# Altium schematic sheet RS232-Sheet.SchDoc
size 420 x 297 mm; SheetNumber: 9; SheetTotal: 15
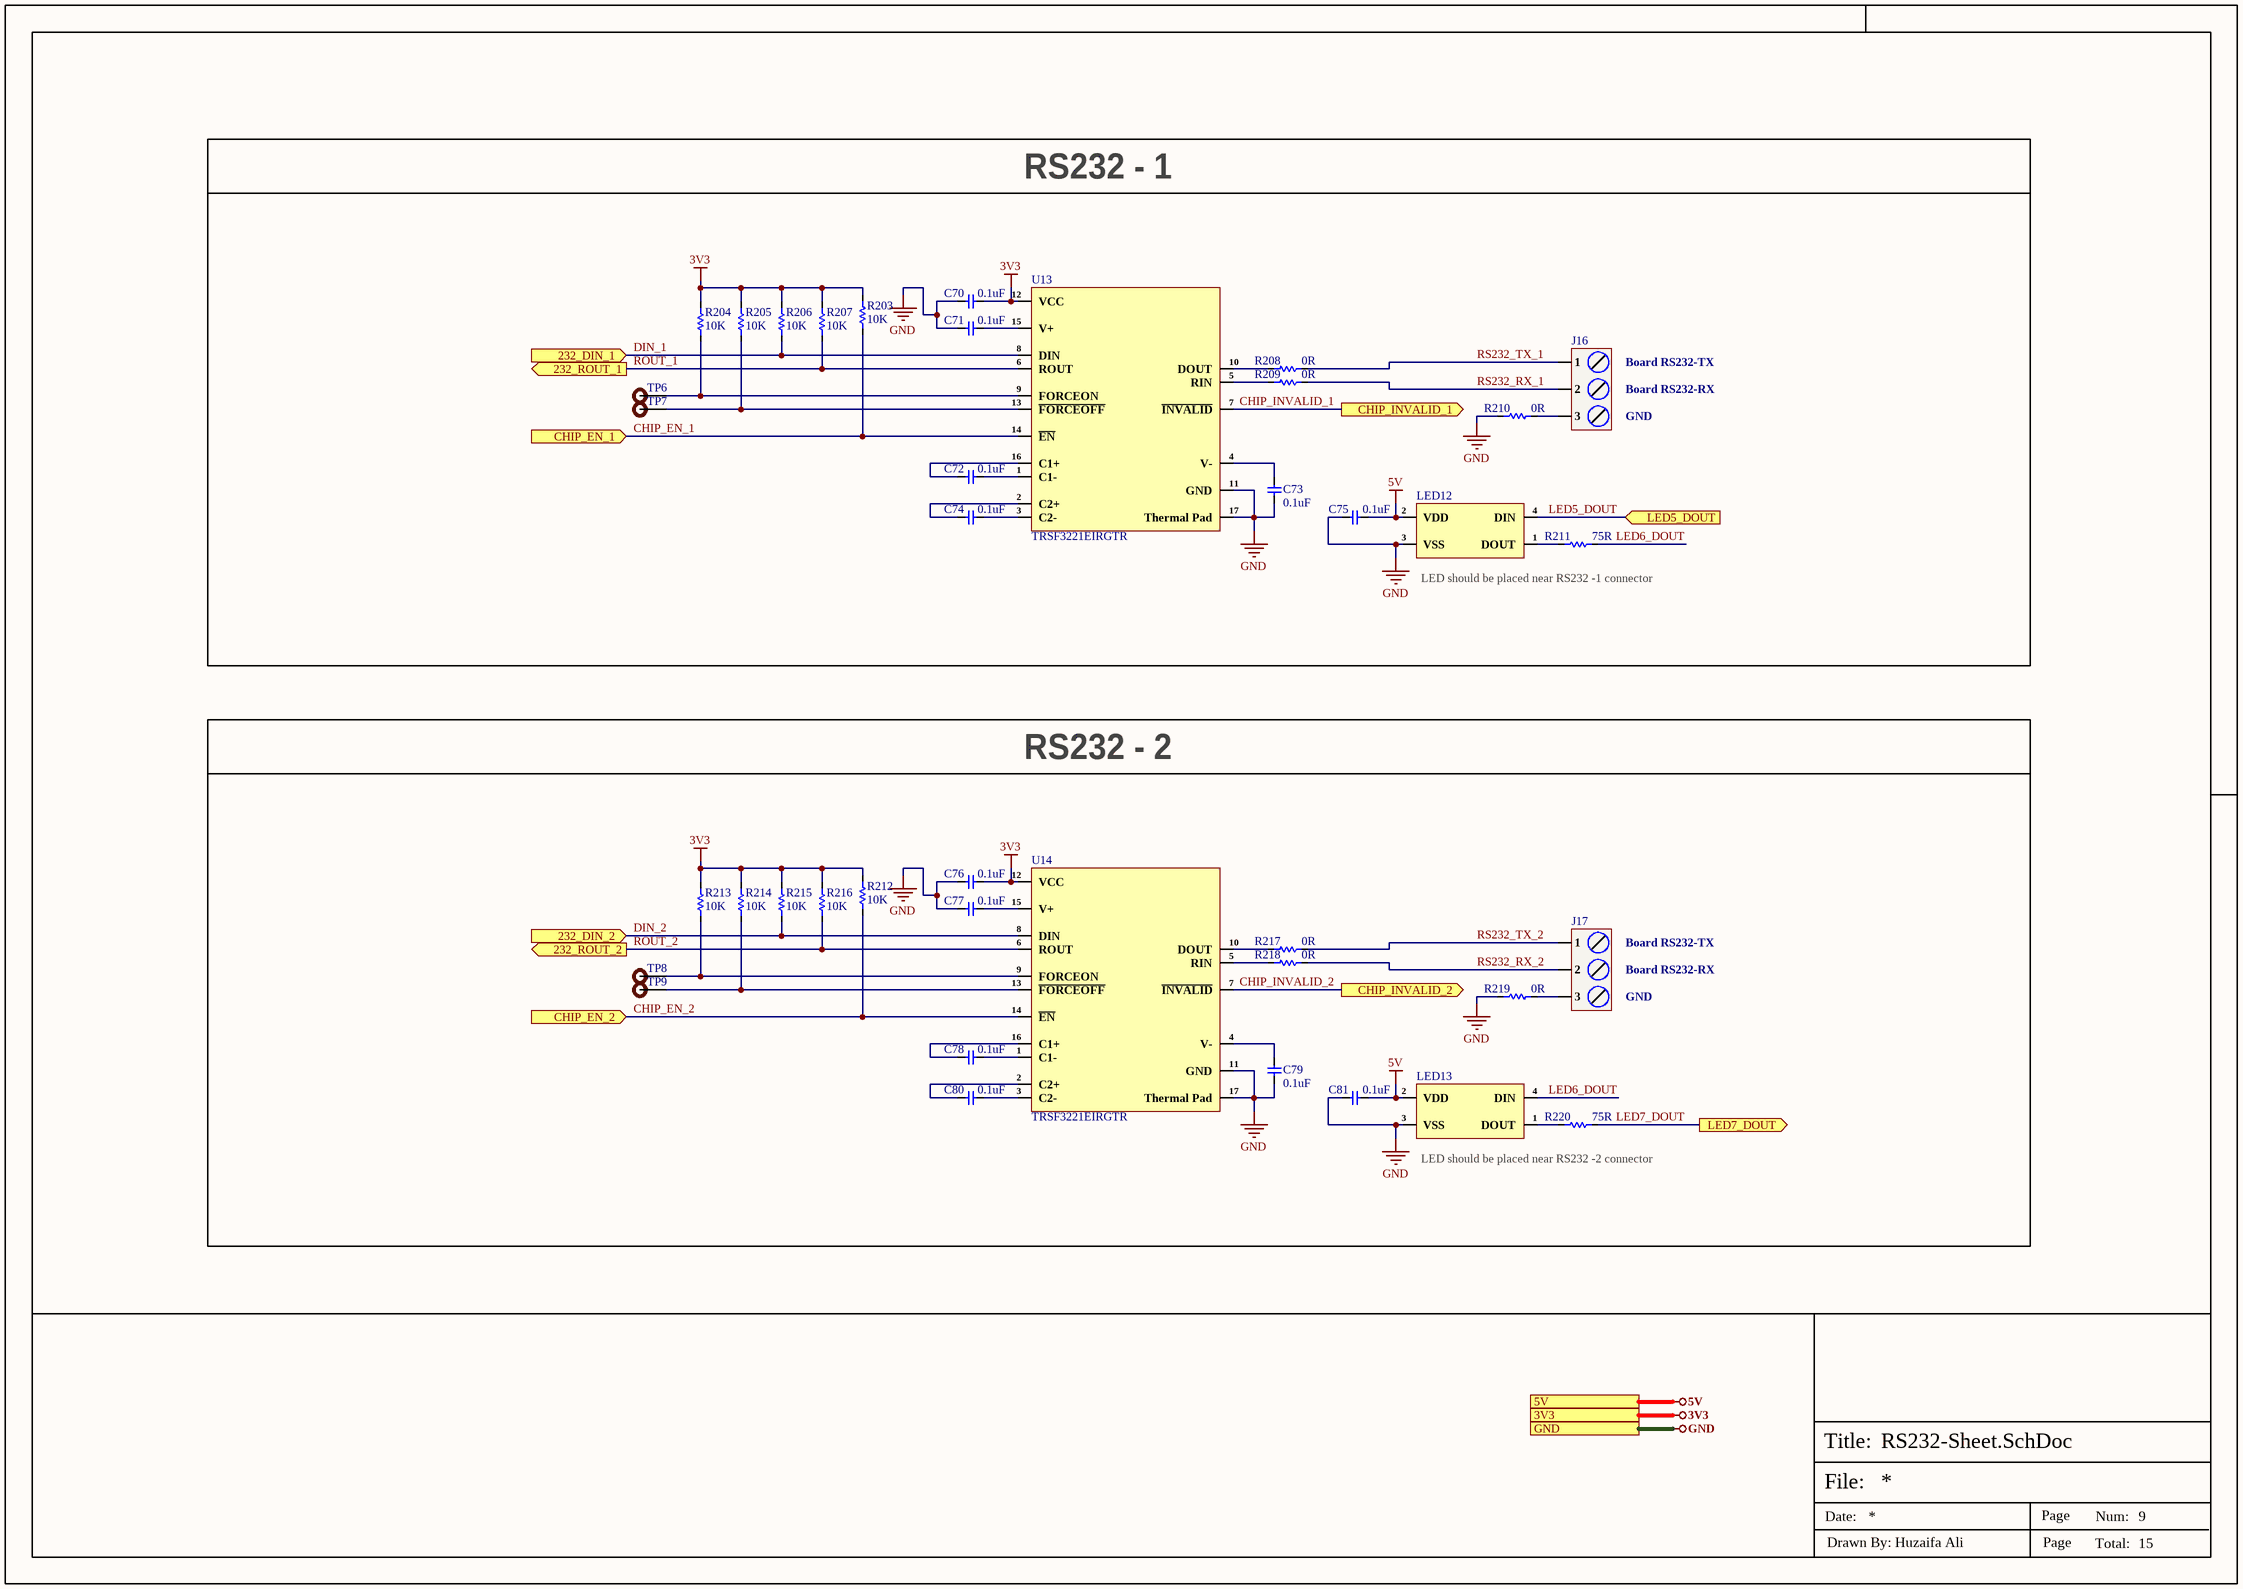
[diagram p0: RS232-Sheet.SchDoc]

## Parts
C70  0.1uF  [Cap-0402]
C71  0.1uF  [Cap-0402]
C72  0.1uF  [Cap-0402]
C73  0.1uF  [Cap-0402]
C74  0.1uF  [Cap-0402]
C75  0.1uF  [Cap-0402]
C76  0.1uF  [Cap-0402]
C77  0.1uF  [Cap-0402]
C78  0.1uF  [Cap-0402]
C79  0.1uF  [Cap-0402]
C80  0.1uF  [Cap-0402]
C81  0.1uF  [Cap-0402]
J16  DB128L-5.08-3P-GN-S  [DB128L-5.08-3P-GN-S]  (value not drawn)
J17  DB128L-5.08-3P-GN-S  [DB128L-5.08-3P-GN-S]  (value not drawn)
LED12  WS2812D-F5  [WS2812D-F5]  (value not drawn)
LED13  WS2812D-F5  [WS2812D-F5]  (value not drawn)
R203  10K  [Res-0402]
R204  10K  [Res-0402]
R205  10K  [Res-0402]
R206  10K  [Res-0402]
R207  10K  [Res-0402]
R208  0R  [Res-0402]
R209  0R  [Res-0402]
R210  0R  [Res-0402]
R211  75R  [Res-0402]
R212  10K  [Res-0402]
R213  10K  [Res-0402]
R214  10K  [Res-0402]
R215  10K  [Res-0402]
R216  10K  [Res-0402]
R217  0R  [Res-0402]
R218  0R  [Res-0402]
R219  0R  [Res-0402]
R220  75R  [Res-0402]
TP6  TEST POINT  [Test-point]  (value not drawn)  (no BOM)
TP7  TEST POINT  [Test-point]  (value not drawn)  (no BOM)
TP8  TEST POINT  [Test-point]  (value not drawn)  (no BOM)
TP9  TEST POINT  [Test-point]  (value not drawn)  (no BOM)
U13  TRSF3221EIRGTR  [16-QFN (3x3).]
U14  TRSF3221EIRGTR  [16-QFN (3x3).]

## Blocks framed on the sheet
RS232 - 1: C70-C75 J16 LED12 R203-R211 TP6 TP7 U13
RS232 - 2: C76-C81 J17 LED13 R212-R220 TP8 TP9 U14

## Ports
3V3 (see Top-Sheet[5B], Buttons-Lights-Sensors-Sheet[4D], CAN-Sheet[5D], Controller-Sheet-1[4D], Controller-Sheet-2[4D], EtherCAT-Sheet[1D], Ethernet-PHY-Sheet[4D], Power-Sheet[4D], RS485-Sheet[5D], USB-Sheet[4D], VFD-Support-Sheet[4D]), 5V (see Top-Sheet[5B], Buttons-Lights-Sensors-Sheet[4D], CAN-Sheet[5D], Controller-Sheet-2[4D], Power-Sheet[4D], RS485-Sheet[5D], USB-Sheet[4D], VFD-Support-Sheet[4D]), 232_DIN_1 (in, see Top-Sheet[5B]), 232_DIN_2 (in, see Top-Sheet[5B]), 232_ROUT_1 (out, see Top-Sheet[5B]), 232_ROUT_2 (out, see Top-Sheet[5B]), CHIP_EN_1 (in, see Top-Sheet[5B]), CHIP_EN_2 (in, see Top-Sheet[5B]), CHIP_INVALID_1 (out, see Top-Sheet[5B]), CHIP_INVALID_2 (out, see Top-Sheet[5B]), GND (see Top-Sheet[5B], Buttons-Lights-Sensors-Sheet[4D], CAN-Sheet[6D], Controller-Sheet-1[4D], Controller-Sheet-2[4D], Controller-Sheet-3[4D], EtherCAT-Sheet[1D], Ethernet-PHY-Sheet[4D], Extra-DIOs[4D], Power-Sheet[4D], RS485-Sheet[5D], USB-Sheet[4D], VFD-Support-Sheet2[4D], VFD-Support-Sheet[4D]), LED5_DOUT (in, see Top-Sheet[5B], CAN-Sheet[5D]), LED7_DOUT (out, see Top-Sheet[5B], RS485-Sheet[5A])

## Nets
3V3: C70.1 C76.1 R203.1 R204.1 R205.1 R206.1 R207.1 R212.1 R213.1 R214.1 R215.1 R216.1 U13.12(VCC) U14.12(VCC) ; port 3V3
5V: C75.2 C81.2 LED12.2(VDD) LED13.2(VDD) ; port 5V
GND: C70.2 C71.2 C73.2 C75.1 C76.2 C77.2 C79.2 C81.1 LED12.3(VSS) LED13.3(VSS) R210.1 R219.1 U13.11(GND) U13.17(Thermal_Pad) U14.11(GND) U14.17(Thermal_Pad) ; port GND
CHIP_EN_1: R203.2 U13.14(~{EN}) ; port CHIP_EN_1
CHIP_EN_2: R212.2 U14.14(~{EN}) ; port CHIP_EN_2
CHIP_INVALID_1: U13.7(~{INVALID}) ; port CHIP_INVALID_1
CHIP_INVALID_2: U14.7(~{INVALID}) ; port CHIP_INVALID_2
DIN_1: R206.2 U13.8(DIN) ; port 232_DIN_1
DIN_2: R215.2 U14.8(DIN) ; port 232_DIN_2
LED5_DOUT: LED12.4(DIN) ; port LED5_DOUT
LED6_DOUT: LED13.4(DIN) R211.2
LED7_DOUT: R220.2 ; port LED7_DOUT
ROUT_1: R207.2 U13.6(ROUT) ; port 232_ROUT_1
ROUT_2: R216.2 U14.6(ROUT) ; port 232_ROUT_2
RS232_RX_1: J16.2 R209.1
RS232_RX_2: J17.2 R218.1
RS232_TX_1: J16.1 R208.1
RS232_TX_2: J17.1 R217.1
NetC71_1: C71.1 U13.15(V+)
NetC72_1: C72.1 U13.1(C1-)
NetC72_2: C72.2 U13.16(C1+)
NetC73_1: C73.1 U13.4(V-)
NetC74_1: C74.1 U13.3(C2-)
NetC74_2: C74.2 U13.2(C2+)
NetC77_1: C77.1 U14.15(V+)
NetC78_1: C78.1 U14.1(C1-)
NetC78_2: C78.2 U14.16(C1+)
NetC79_1: C79.1 U14.4(V-)
NetC80_1: C80.1 U14.3(C2-)
NetC80_2: C80.2 U14.2(C2+)
NetJ16_3: J16.3 R210.2
NetJ17_3: J17.3 R219.2
NetLED12_1: LED12.1(DOUT) R211.1
NetLED13_1: LED13.1(DOUT) R220.1
NetR204_2: R204.2 TP6.1 U13.9(FORCEON)
NetR205_2: R205.2 TP7.1 U13.13(~{FORCEOFF})
NetR208_2: R208.2 U13.10(DOUT)
NetR209_2: R209.2 U13.5(RIN)
NetR213_2: R213.2 TP8.1 U14.9(FORCEON)
NetR214_2: R214.2 TP9.1 U14.13(~{FORCEOFF})
NetR217_2: R217.2 U14.10(DOUT)
NetR218_2: R218.2 U14.5(RIN)

## Notes on the sheet
- Board RS232-TX
- Board RS232-RX
- GND
- LED should be placed near RS232 -1 connector
- LED should be placed near RS232 -2 connector
- File:
- Title:
- Date:
- Page
- Num:
- Total:
- Drawn By: Huzaifa Ali

## Library data of the parts
C70-C81 = CC0402JRX7R7BB104: CAP CER 0.1UF 16V X7R 0402; Manufacturer: Yageo; Material: 4241ConductorMaterial; Value: 100nF; Tolerance: 5%; Item Type: Capacitor; Supplier: Digikey; Supplier Part Number: 311-1676-1-ND; Manufacturer Part Number: CC0402JRX7R7BB104; RoHS: Yes; Category: Ceramic Capacitors; Stock: 1659111; Pricing: 1=0.1, 10=0.046, 50=0.0262, 100=0.0203, 500=0.01528, 1000=0.012, 2500=0.01091, 5000=0.01004 (USD); Mounting Technology: Surface Mount; Case/Package: 0402; Case Code (Metric): 1005; Case Code (Imperial): 0402; Min Operating Temperature: -55°C; Max Operating Temperature: 125°C; Dielectric: X7R; Packaging: Tape and Reel; Package Quantity: 10000; Voltage Rating (DC): 16V; Voltage Rating: 16V; Series: CC; Construction: Flat; Length: 0.039inch; Width: 0.02inch; Height: 0.5mm; Thickness: 0.022inch; Lead Free: Lead Free; Halogen Free: Halogen Free; RoHS Compliant: Yes; ComponentLink1URL: https://datasheet.ciiva.com/13210/upy-gphc-x7r-6-3v-to-50v-8-12304-13210152.pdf?src-supplier=Mouser; ComponentLink1Description: https://datasheet.ciiva.com/13210/upy-gphc-x7r-6-3v-to-50v-8-12304-13210152.pdf?src-supplier=Mouser; LCSC Part Number: C541464
J16 J17 = DB128L-5.08-3P-GN-S: 1x3P 18A -40℃~+105℃ 250V Green 12~30 Direct Insert 5.08mm 2.5 1 3 Plugin,P=5.08mm Screw Terminal Blocks ROHS; Manufacturer: DORABO; Manufacturer Part Number: DB128L-5.08-3P-GN-S; Package: Plugin,P=5.08mm; LCSC Part Number: C395869; Item Type: Terminal Block; ComponentLink1Description: LCSC; ComponentLink1URL: https://www.lcsc.com/product-detail/Screw-Terminal-Blocks_DORABO-DB128L-5-08-3P-GN-S_C395869.html
LED12 LED13 = WS2812D-F5: Plugin,D=5mm RGB LEDs ROHS; Manufacturer: Worldsemi; Item Type: RGB LED; Manufacturer Part Number: WS2812D-F5; Package: Plugin,D=5mm; LCSC Part Number: C190565; ComponentLink1Description: LCSC; ComponentLink1URL: https://jlcpcb.com/partdetail/Worldsemi-WS2812DF5/C190565
R203-R207 R212-R216 = RC0402FR-0710KL: RES 10K OHM 1% 1/16W 0402; Manufacturer: Yageo; Resistance: 10kR; Voltage Rating (DC): 50V; Temperature Coefficient: 100ppm/°C; Power Rating: 62.5mW; Max Power Dissipation: 63mW; Item Type: Resistor; Supplier 1: Mouser; Manufacturer Part Number: RC0402FR-0710KL; RoHS: Yes; Category: Chip SMD Resistors; Stock 1: 18648329; Pricing 1: 1=0.10000, 10=0.01400, 50=0.01400, 100=0.00500, 1000=0.00300, 10000=0.00200 (USD); Case/Package: 0402; Number of Pins: 2; Case Code (Imperial): 0402; Case Code (Metric): 1005; Min Operating Temperature: -55°C; Max Operating Temperature: 155°C; Resistor Type: Thick Film; Tolerance: 1%; Packaging: Tape and Reel; Voltage Rating: 50V; Termination: SMD/SMT; Working Voltage: 50V; Number of Terminations: 2; Features: Moisture Resistant; Series: RC; Resistance Tolerance: 1%; Construction: Rectangular; Length: 1mm; Width: 0.5mm; Height: 0.32mm; Depth: 0.5mm; Lead Pitch: 0.2mm; REACH SVHC: No SVHC; Lead Free: Lead Free; RoHS Compliant: Yes; Military Standard: Not; ComponentLink1URL: https://datasheet.ciiva.com/7660/38568-7660787.pdf?src-supplier=Element14; ComponentLink1Description: https://datasheet.ciiva.com/7660/38568-7660787.pdf?src-supplier=Element14; ComponentLink2URL: https://datasheet.ciiva.com/7849/1686128-7849814.pdf?src-supplier=Element14; ComponentLink2Description: https://datasheet.ciiva.com/7849/1686128-7849814.pdf?src-supplier=Element14; ComponentLink3URL: https://datasheet.ciiva.com/7983/1018594-7983486.pdf?src-supplier=Element14; ComponentLink3Description: https://datasheet.ciiva.com/7983/1018594-7983486.pdf?src-supplier=Element14; ComponentLink4URL: https://datasheet.ciiva.com/22747/1018594-22747512.pdf?src-supplier=Element14; ComponentLink4Description: https://datasheet.ciiva.com/22747/1018594-22747512.pdf?src-supplier=Element14; ComponentLink5URL: https://datasheet.ciiva.com/12667/pyu-rc0402-51-rohs-l-6-r-12667067.pdf?src-supplier=Mouser; ComponentLink5Description: https://datasheet.ciiva.com/12667/pyu-rc0402-51-rohs-l-6-r-12667067.pdf?src-supplier=Mouser; ComponentLink6URL: https://datasheet.ciiva.com/7849/1784430-7849813.pdf?src-supplier=Element14; ComponentLink6Description: https://datasheet.ciiva.com/7849/1784430-7849813.pdf?src-supplier=Element14; ComponentLink7URL: https://datasheet.ciiva.com/7849/1784430-7849815.pdf?src-supplier=Element14; ComponentLink7Description: https://datasheet.ciiva.com/7849/1784430-7849815.pdf?src-supplier=Element14; Supplier Part Number 1: 603-RC0402FR-0710KL; LCSC Part Number: C60490
R208-R210 R217-R219 = RC0402FR-070RL: RES 0 OHM JUMPER 1/16W 0402; Manufacturer: Yageo; Item Type: Resistors; Tolerance: 1%; Power Rating: 62.5mW; Voltage Rating: 50V; Temperature Coefficient: 200ppm/°C; Max Power Dissipation: 63mW; Supplier 1: Mouser; Manufacturer Part Number: RC0402FR-070RL; RoHS: Yes; Stock 1: 8556842; Pricing 1: 1=0.10000, 10=0.01400, 50=0.01400, 100=0.00600, 1000=0.00300, 5000=0.00200, 10000=0.00100 (USD); Mount: Surface Mount; Case/Package: 0402; Contact Plating: Tin,Matte; Case Code (Imperial): 0402; Case Code (Metric): 1005; Size Code: 0402; Min Operating Temperature: -55°C; Max Operating Temperature: 155°C; Resistance: 0R; Resistor Type: Thick Film; Packaging: Tape and Reel; Termination: SMD/SMT; Features: Moisture Resistant; Series: RC; Number of Terminations: 2; Length: 1mm; Width: 0.5mm; Height: 0.35mm; Radiation Hardening: No; Lead Free: Lead Free; RoHS Compliant: Yes; ComponentLink1URL: https://datasheet.ciiva.com/8896/pyu-rc0402-51-rohs-l-6-8896149.pdf?src-supplier=Avnet; ComponentLink1Description: https://datasheet.ciiva.com/8896/pyu-rc0402-51-rohs-l-6-8896149.pdf?src-supplier=Avnet; ComponentLink2URL: https://datasheet.ciiva.com/16790/pyu-rc0402-51-rohs-l-6-r-16790444.pdf?src-supplier=Future+Electronics; ComponentLink2Description: https://datasheet.ciiva.com/16790/pyu-rc0402-51-rohs-l-6-r-16790444.pdf?src-supplier=Future+Electronics; Supplier Part Number 1: 603-RC0402FR-070RL; LCSC Part Number: C106231
R211 R220 = RC0402JR-0775RL: RES 75 OHM 5% 1/16W 0402; Manufacturer: Yageo; Item Type: Resistor; Temperature Coefficient: 100ppm/°C; Power Rating: 62.5mW; Voltage Rating: 50V; Max Power Dissipation: 63mW; Supplier: Digikey; Supplier Part Number: 311-75JRCT-ND; Manufacturer Part Number: RC0402JR-0775RL; RoHS: Yes; Stock: 2993323; Pricing: 1=0.1, 10=0.018, 50=0.0102, 100=0.0083, 500=0.00528, 1000=0.00444, 5000=0.00307 (USD); Case/Package: 0402; Pins: 2; Contact Plating: Tin,Lead; Case Code (Imperial): 0402; Case Code (Metric): 1005; Min Operating Temperature: -55°C; Max Operating Temperature: 155°C; Value: 75R; Tolerance: 5%; Resistor Type: Thick Film; Packaging: Tape and Reel; Termination: SMD/SMT; Voltage Rating (DC): 50V; Features: Moisture Resistant; Series: RC; Number of Terminations: 2; Resistance Tolerance: 5%; Length: 1mm; Width: 0.5mm; Height: 0.35mm; Reach SVHC Compliant: No; Lead Free: Lead Free; RoHS Compliant: Yes; ComponentLink1URL: https://datasheet.ciiva.com/7983/1018594-7983612.pdf?src-supplier=Element14; ComponentLink1Description: https://datasheet.ciiva.com/7983/1018594-7983612.pdf?src-supplier=Element14; ComponentLink2URL: https://datasheet.ciiva.com/17082/pyu-rc0402-51-rohs-l-6-r-17082239.pdf?src-supplier=Future+Electronics; ComponentLink2Description: https://datasheet.ciiva.com/17082/pyu-rc0402-51-rohs-l-6-r-17082239.pdf?src-supplier=Future+Electronics; LCSC Part Number: C137841
TP6-TP9 = TEST POINT: Test Point ON; Item Type: TEST POINT
U13 U14 = TRSF3221EIRGTR: IC TRANSCEIVER FULL 1/1 16VQFN; Manufacturer: Texas Instruments; Supplier: Mouser; LCSC Part Number: C2861230; Manufacturer Part Number: TRSF3221EIRGTR; RoHS: No; Item Type: IC; Stock: 8746; Pricing: 1=2.41, 10=1.64, 50=1.64, 100=1.47, 1000=1.3, 10000=1.24 (USD)